# Altium schematic sheet PIC18F16Q20_Curiosity_Nano_TopLevel.SchDoc
size A3; SheetTitle: Top Level; CompanyName: Microchip Technology Inc.; Organization: Microchip Technology; Address1: 2355 West Chandler Blvd.; Address2: Chandler, AZ  85224; Address4: USA; SheetNumber: 1; SheetTotal: 5; Time: Time
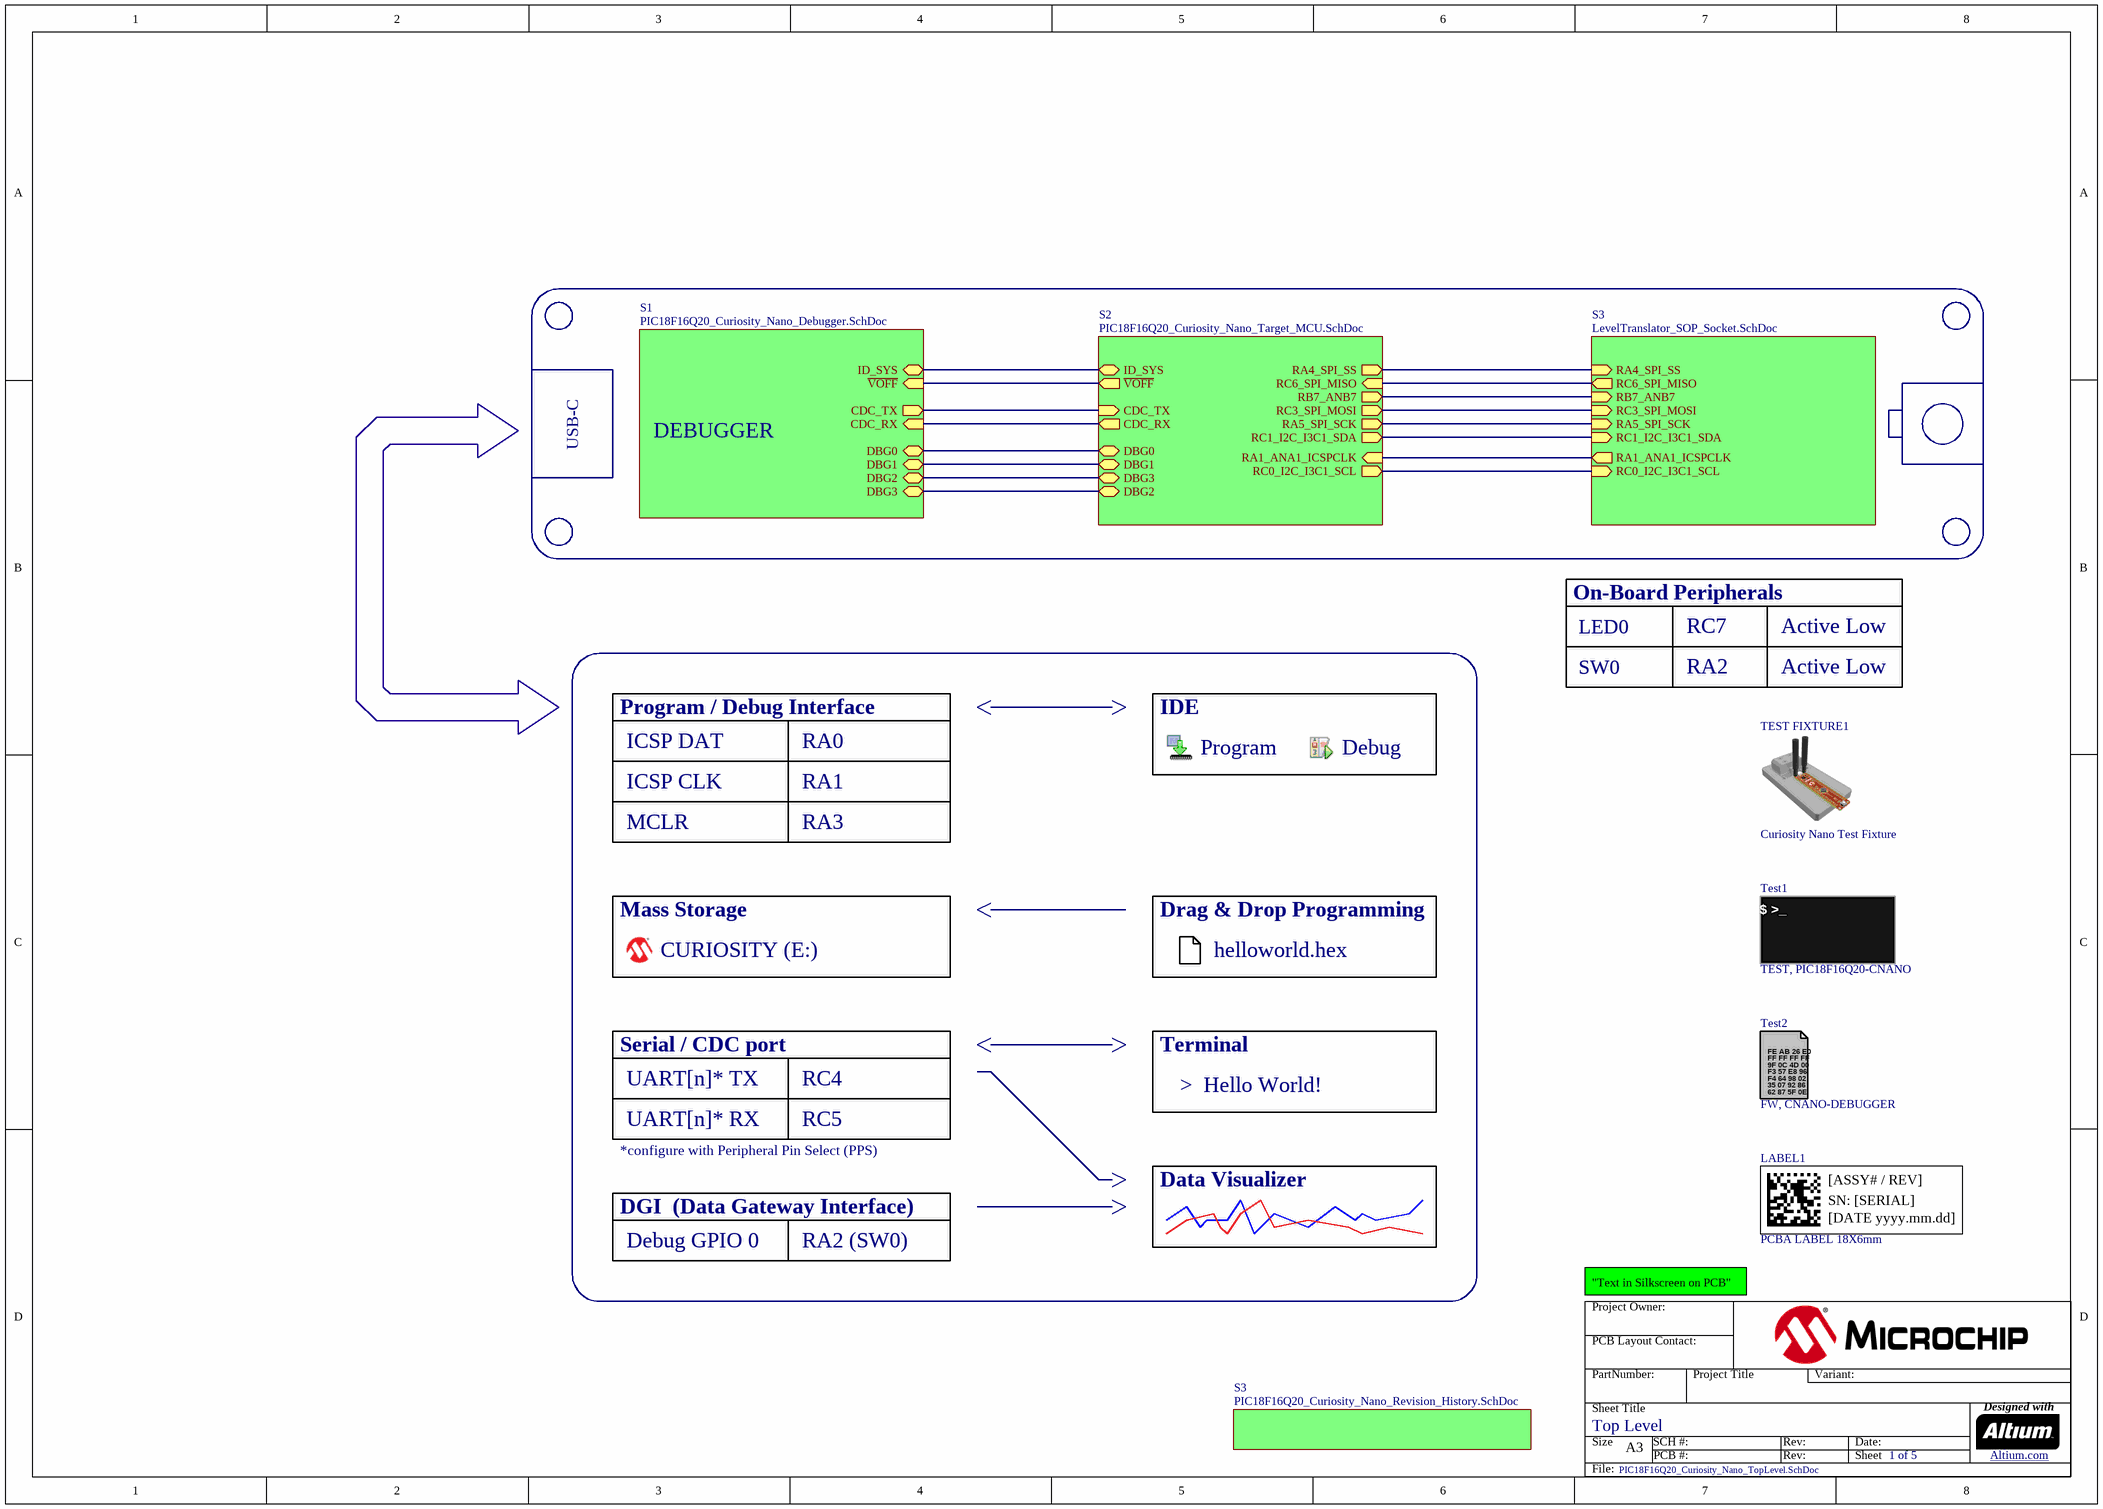
[diagram p0: PIC18F16Q20_Curiosity_Nano_TopLevel.SchDoc]

## Parts
LABEL1  value PCBA LABEL 18X6mm  [08-10015]  (hidden comment: 08-10015)
Test1  Description_: TEST, PIC18F16Q20-CNANO  (hidden comment: Mechanical)  (mechanical)
Test2  Description_: FW, CNANO-DEBUGGER  (hidden comment: Mechanical)  (mechanical)
TEST_FIXTURE1  value Curiosity Nano Test Fixture  (hidden comment: Jupiter Test Jig)  (mechanical)

## Sub-sheets
S1 = PIC18F16Q20_Curiosity_Nano_Debugger.SchDoc: DBG2 (bidir), DBG1 (bidir), DBG3 (bidir), DBG0 (bidir), ~{VOFF} (in), ID_SYS (bidir), CDC_RX (in), CDC_TX (out)
S2 = PIC18F16Q20_Curiosity_Nano_Target_MCU.SchDoc: DBG0 (bidir), DBG1 (bidir), DBG3 (bidir), DBG2 (bidir), ~{VOFF} (out), ID_SYS (bidir), CDC_TX (in), CDC_RX (out), RA4_SPI_SS (out), RA5_SPI_SCK (out), RC1_I2C_I3C1_SDA (out), RC3_SPI_MOSI (out), RC6_SPI_MISO (in), RB7_ANB7 (out), RA1_ANA1_ICSPCLK (in), RC0_I2C_I3C1_SCL (out)
S3 = PIC18F16Q20_Curiosity_Nano_Revision_History.SchDoc: no entries
S3 = LevelTranslator_SOP_Socket.SchDoc: RA4_SPI_SS (in), RA5_SPI_SCK (in), RC1_I2C_I3C1_SDA (in), RC3_SPI_MOSI (in), RC6_SPI_MISO (out), RB7_ANB7 (in), RA1_ANA1_ICSPCLK (out), RC0_I2C_I3C1_SCL (in)

## Nets
(unnamed): sheet S2/DBG0, sheet S1/DBG0
(unnamed): sheet S2/DBG1, sheet S1/DBG1
(unnamed): sheet S2/DBG3, sheet S1/DBG2
(unnamed): sheet S2/DBG2, sheet S1/DBG3
(unnamed): sheet S2/~{VOFF}, sheet S1/~{VOFF}
(unnamed): sheet S2/ID_SYS, sheet S1/ID_SYS
(unnamed): sheet S2/CDC_TX, sheet S1/CDC_TX
(unnamed): sheet S2/CDC_RX, sheet S1/CDC_RX
(unnamed): sheet S2/RA4_SPI_SS, sheet S3/RA4_SPI_SS
(unnamed): sheet S2/RA5_SPI_SCK, sheet S3/RA5_SPI_SCK
(unnamed): sheet S2/RC1_I2C_I3C1_SDA, sheet S3/RC1_I2C_I3C1_SDA
(unnamed): sheet S2/RC3_SPI_MOSI, sheet S3/RC3_SPI_MOSI
(unnamed): sheet S2/RC6_SPI_MISO, sheet S3/RC6_SPI_MISO
(unnamed): sheet S2/RB7_ANB7, sheet S3/RB7_ANB7
(unnamed): sheet S2/RA1_ANA1_ICSPCLK, sheet S3/RA1_ANA1_ICSPCLK
(unnamed): sheet S2/RC0_I2C_I3C1_SCL, sheet S3/RC0_I2C_I3C1_SCL

## Notes on the sheet
- USB-C
- DEBUGGER
- On-Board Peripherals
- LED0
- RC7
- Active Low
- Program / Debug Interface
- IDE
- SW0
- RA2
- ICSP DAT
- RA0
- Program
- Debug
- ICSP CLK
- MCLR
- RA1
- RA3
- Mass Storage
- Drag & Drop Programming
- CURIOSITY (E:)
- helloworld.hex
- Serial / CDC port
- Terminal
- UART[n]* TX
- UART[n]* RX
- RC5
- RC4
- >  Hello World!
- *configure with Peripheral Pin Select (PPS)
- Data Visualizer
- DGI  (Data Gateway Interface)
- Debug GPIO 0
- RA2 (SW0)
- "Text in Silkscreen on PCB"
- Project Owner:
- PCB Layout Contact:
- PartNumber:
- Project Title
- Variant:
- Sheet Title
- Size
- A3
- SCH #:
- PCB #:
- Rev:
- Date:
- Sheet
- Designed with
- Altium.com <http://go.altium.com/MicrochipLandingPage_Evaluation.html>
- File:
- (in symbol 08-10015) [ASSY# / REV]; SN: [SERIAL]; [DATE yyyy.mm.dd]
- (in symbol 13-00018) FE AB 26 E0; FF FF FF FF; 9F 0C 4D 00; F3 57 E8 96; F4 64 98 02; 35 07 92 86; 62 87 5F 0E
- (in symbol 13-00211) $ >_

## Library data of the parts
LABEL1 = 08-10015: Manufacturer 1: ACT Logimark AS; Manufacturer Part Number 1: 505462; Description_: LABEL PCBA 18x6mm Datamatrix Assy# / Rev / Serial / Date; Populated: MECH; MCHP-ID: 08-10015; Revision: 4; Symbol: 08-10015; Category: MCHP-Manufacturing; Quantity Override: 1; Type: PCBA Label; Manufacturer 2: Sunrise Paper (M) Sdn Bhd; Manufacturer Part Number 2: 037268-5; Manufacturer 3: Raynen; Manufacturer Part Number 3: 10010407; Supplier 1: ACT Logimark AS; Supplier Part Number 1: 505462; Supplier 2: Microchip Technology; Supplier Part Number 2: 01000-004967; Supplier 3: Raynen; Supplier Part Number 3: 10010407
Test1 = 13-00211: Populated: Yes; MCHP-ID: 13-00211; Quantity Override: 1; Revision: 2; Category: MCHP-Manufacturing
Test2 = 13-00018: Populated: Yes; Value: Debugger Firmware; MCHP-ID: 13-00018; Quantity Override: 1; Revision: 6; Type: Test Procedure Firmware; Category: MCHP-Manufacturing
TEST_FIXTURE1 = 15-00009: Manufacturer 1: Raynen; Manufacturer Part Number 1: MCHP 15-00009; Populated: YES; MCHP-ID: 15-00009; Revision: 4; Symbol: Jupiter Test Jig; Description_: Curiosity Nano Test Fixture; Type: Test Fixture; Category: MCHP-Manufacturing; Quantity Override: 1; Manufacturer 2: STRiDE Electronics (Malaysia) Sdn. Bhd.; Manufacturer Part Number 2: MCHP 12-11423; Supplier 1: Raynen; Supplier 2: STRiDE Electronics (Malaysia) Sdn. Bhd.; Supplier Part Number 1: MCHP 15-00009; Supplier Part Number 2: MCHP 12-11423